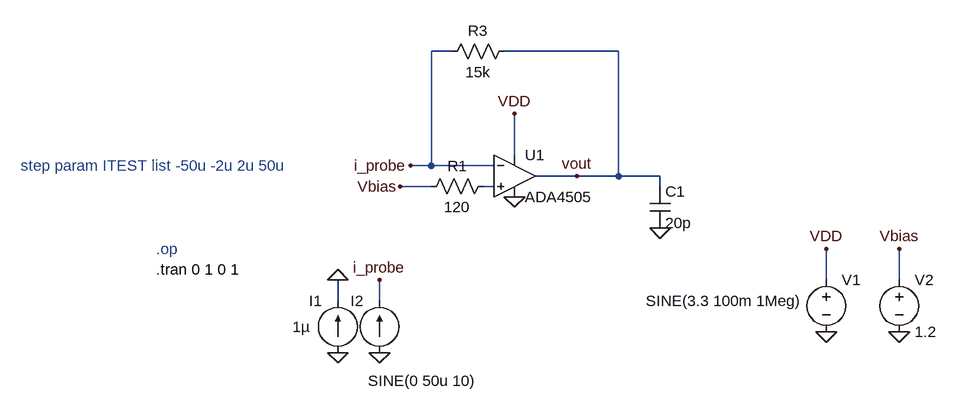
[diagram p0: schematic sensing_ADA4505.asc]
sensing_ADA4505.asc, the LTspice schematic file:
Version 4.1
SHEET 1 1552 820
WIRE 656 240 624 240
WIRE 912 240 736 240
WIRE 752 400 752 336
WIRE 624 416 624 240
WIRE 624 416 592 416
WIRE 720 416 624 416
WIRE 848 432 784 432
WIRE 912 432 912 240
WIRE 912 432 848 432
WIRE 976 432 912 432
WIRE 624 448 576 448
WIRE 720 448 704 448
WIRE 976 448 976 432
WIRE 1232 592 1232 544
WIRE 1344 592 1344 544
WIRE 480 624 480 592
WIRE 544 624 544 592
FLAG 592 416 i_probe
FLAG 1232 544 VDD
FLAG 1344 672 0
FLAG 1344 544 Vbias
FLAG 480 704 0
FLAG 544 704 0
FLAG 544 592 i_probe
FLAG 576 448 Vbias
FLAG 752 464 0
FLAG 752 336 VDD
FLAG 1232 672 0
FLAG 480 592 0
FLAG 848 432 vout
FLAG 976 512 0
SYMBOL voltage 1232 576 R0
WINDOW 123 0 0 Left 0
WINDOW 39 0 0 Left 0
WINDOW 3 -278 48 Left 2
SYMATTR Value SINE(3.3 100m 1Meg)
SYMATTR InstName V1
SYMBOL voltage 1344 576 R0
WINDOW 123 0 0 Left 0
WINDOW 39 0 0 Left 0
SYMATTR InstName V2
SYMATTR Value 1.2
SYMBOL res 752 224 R90
WINDOW 0 0 56 VBottom 2
WINDOW 3 32 56 VTop 2
SYMATTR InstName R3
SYMATTR Value 15k
SYMBOL current 480 704 R180
WINDOW 0 24 80 Left 2
WINDOW 3 43 40 Left 2
WINDOW 123 0 0 Left 0
WINDOW 39 0 0 Left 0
SYMATTR InstName I1
SYMATTR Value 1µ
SYMBOL current 544 704 R180
WINDOW 0 24 80 Left 2
WINDOW 3 -149 -43 Left 2
WINDOW 123 0 0 Left 0
WINDOW 39 0 0 Left 0
SYMATTR InstName I2
SYMATTR Value SINE(0 50u 10)
SYMBOL OpAmps\\ADA4505 752 368 R0
SYMATTR InstName U1
SYMBOL cap 960 448 R0
SYMATTR InstName C1
SYMATTR Value 20p
SYMBOL res 720 432 R90
WINDOW 0 0 56 VBottom 2
WINDOW 3 32 56 VTop 2
SYMATTR InstName R1
SYMATTR Value 120
TEXT 200 544 Left 2 ;.op
TEXT 200 576 Left 2 !.tran 0 1 0 1
TEXT -8 416 Left 2 ;step param ITEST list -50u -2u 2u 50u

The netlist it stands for:
* sensing_ADA4505.asc
V1 VDD 0 SINE(3.3 100m 1Meg)
V2 Vbias 0 1.2
R3 vout i_probe 15k
I1 0 0 1µ
I2 0 i_probe SINE(0 50u 10)
X§U1 N001 i_probe VDD 0 vout ADA4505  ; pins In+ In- V+ V- OUT
C1 vout 0 20p
R1 N001 Vbias 120
* .op
.tran 0 1 0 1
* step param ITEST list -50u -2u 2u 50u
.backanno
.end